# Altium schematic sheet pc_data_bus_leds.SchDoc
size A3; SheetNumber: 9; SheetTotal: 18
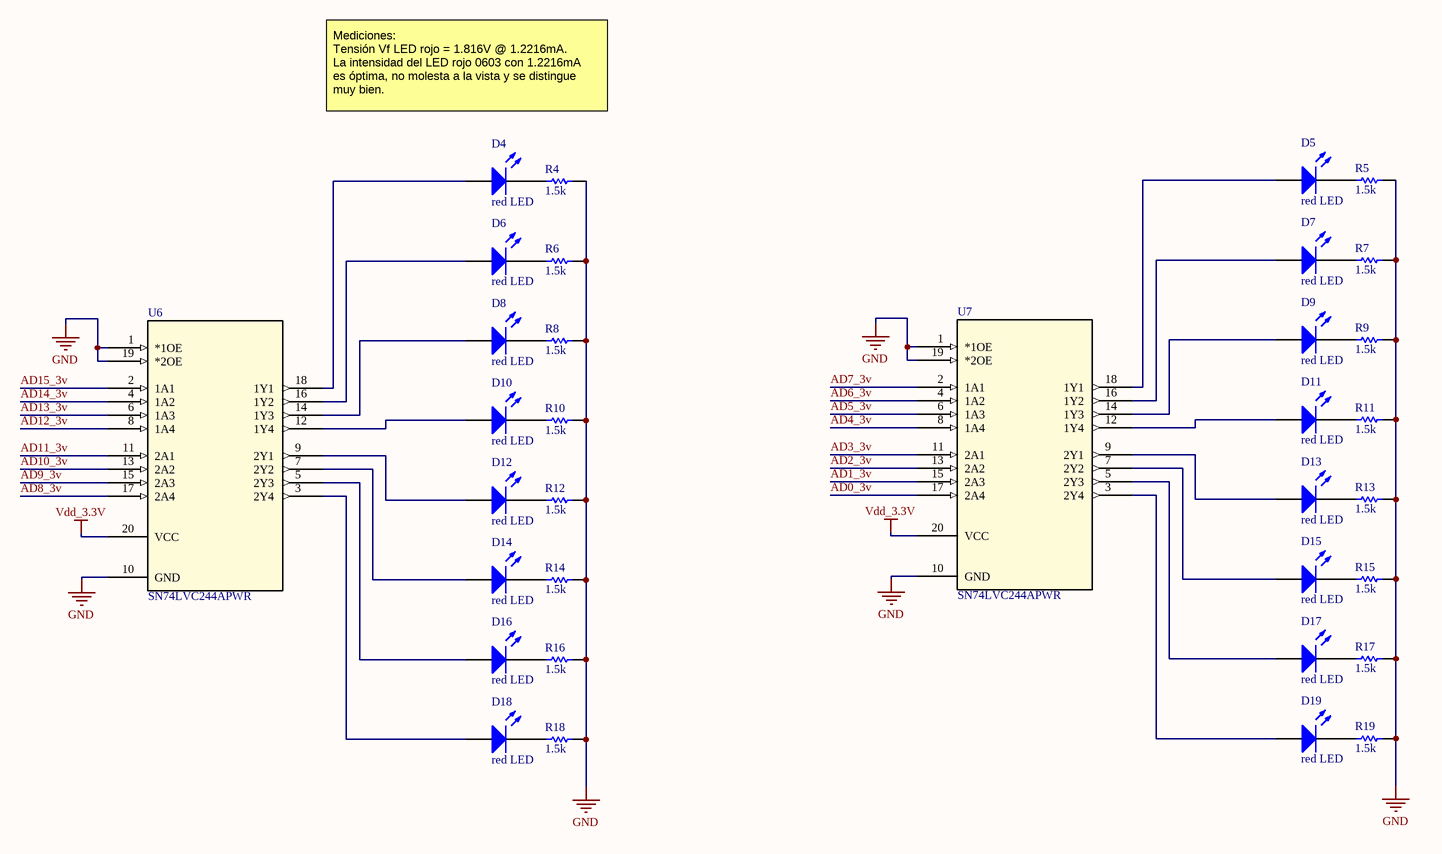
[diagram p0: pc_data_bus_leds.SchDoc]

## Parts
D4  red LED  [led 0603 clear]
D5  red LED  [led 0603 clear]
D6  red LED  [led 0603 clear]
D7  red LED  [led 0603 clear]
D8  red LED  [led 0603 clear]
D9  red LED  [led 0603 clear]
D10  red LED  [led 0603 clear]
D11  red LED  [led 0603 clear]
D12  red LED  [led 0603 clear]
D13  red LED  [led 0603 clear]
D14  red LED  [led 0603 clear]
D15  red LED  [led 0603 clear]
D16  red LED  [led 0603 clear]
D17  red LED  [led 0603 clear]
D18  red LED  [led 0603 clear]
D19  red LED  [led 0603 clear]
R4  value 1.5k  [resistor 0603]  (hidden comment: resistor)
R5  value 1.5k  [resistor 0603]  (hidden comment: resistor)
R6  value 1.5k  [resistor 0603]  (hidden comment: resistor)
R7  value 1.5k  [resistor 0603]  (hidden comment: resistor)
R8  value 1.5k  [resistor 0603]  (hidden comment: resistor)
R9  value 1.5k  [resistor 0603]  (hidden comment: resistor)
R10  value 1.5k  [resistor 0603]  (hidden comment: resistor)
R11  value 1.5k  [resistor 0603]  (hidden comment: resistor)
R12  value 1.5k  [resistor 0603]  (hidden comment: resistor)
R13  value 1.5k  [resistor 0603]  (hidden comment: resistor)
R14  value 1.5k  [resistor 0603]  (hidden comment: resistor)
R15  value 1.5k  [resistor 0603]  (hidden comment: resistor)
R16  value 1.5k  [resistor 0603]  (hidden comment: resistor)
R17  value 1.5k  [resistor 0603]  (hidden comment: resistor)
R18  value 1.5k  [resistor 0603]  (hidden comment: resistor)
R19  value 1.5k  [resistor 0603]  (hidden comment: resistor)
U6  SN74LVC244APWR  [PW20]
U7  SN74LVC244APWR  [PW20]

## Nets
GND: R4.1 R5.1 R6.1 R7.1 R8.1 R9.1 R10.1 R11.1 R12.1 R13.1 R14.1 R15.1 R16.1 R17.1 R18.1 R19.1 U6.1(*1OE) U6.10(GND) U6.19(*2OE) U7.1(*1OE) U7.10(GND) U7.19(*2OE)
Vdd_3.3V: U6.20(VCC) U7.20(VCC)
AD0_3v: U7.17(2A4)
AD1_3v: U7.15(2A3)
AD2_3v: U7.13(2A2)
AD3_3v: U7.11(2A1)
AD4_3v: U7.8(1A4)
AD5_3v: U7.6(1A3)
AD6_3v: U7.4(1A2)
AD7_3v: U7.2(1A1)
AD8_3v: U6.17(2A4)
AD9_3v: U6.15(2A3)
AD10_3v: U6.13(2A2)
AD11_3v: U6.11(2A1)
AD12_3v: U6.8(1A4)
AD13_3v: U6.6(1A3)
AD14_3v: U6.4(1A2)
AD15_3v: U6.2(1A1)
NetD4_1: D4.1(A) U6.18(1Y1)
NetD4_2: D4.2(K) R4.2
NetD5_1: D5.1(A) U7.18(1Y1)
NetD5_2: D5.2(K) R5.2
NetD6_1: D6.1(A) U6.16(1Y2)
NetD6_2: D6.2(K) R6.2
NetD7_1: D7.1(A) U7.16(1Y2)
NetD7_2: D7.2(K) R7.2
NetD8_1: D8.1(A) U6.14(1Y3)
NetD8_2: D8.2(K) R8.2
NetD9_1: D9.1(A) U7.14(1Y3)
NetD9_2: D9.2(K) R9.2
NetD10_1: D10.1(A) U6.12(1Y4)
NetD10_2: D10.2(K) R10.2
NetD11_1: D11.1(A) U7.12(1Y4)
NetD11_2: D11.2(K) R11.2
NetD12_1: D12.1(A) U6.9(2Y1)
NetD12_2: D12.2(K) R12.2
NetD13_1: D13.1(A) U7.9(2Y1)
NetD13_2: D13.2(K) R13.2
NetD14_1: D14.1(A) U6.7(2Y2)
NetD14_2: D14.2(K) R14.2
NetD15_1: D15.1(A) U7.7(2Y2)
NetD15_2: D15.2(K) R15.2
NetD16_1: D16.1(A) U6.5(2Y3)
NetD16_2: D16.2(K) R16.2
NetD17_1: D17.1(A) U7.5(2Y3)
NetD17_2: D17.2(K) R17.2
NetD18_1: D18.1(A) U6.3(2Y4)
NetD18_2: D18.2(K) R18.2
NetD19_1: D19.1(A) U7.3(2Y4)
NetD19_2: D19.2(K) R19.2

## Notes on the sheet
- Mediciones:
  Tensión Vf LED rojo = 1.816V @ 1.2216mA.
  La intensidad del LED rojo 0603 con 1.2216mA
  es óptima, no molesta a la vista y se distingue
  muy bien.

## Library data of the parts
D4-D19 = LED2: Red LED 0603; Package: 0603 - 3.2X1.6X1.1; LCSC part: C2286
U6 U7 = SN74LVC244APWR: 8-ch, 1.65-V to 3.6-V buffers with 3-state outputs 20-TSSOP -40 to 125; Manufacturer_Name: Texas Instruments; Copyright: Copyright (C) 2026 Ultra Librarian. All rights reserved.; Manufacturer_Part_Number: SN74LVC244APWR; Datasheet: https://www.ti.com/lit/gpn/sn74lvc244a; RefDes: RefDes; Type: Type
R4-R19 = resistor: LCSC part: C22843; Package: 0603